# Altium schematic sheet HMI_Encoder_NFC_Sheet.SchDoc
size A4
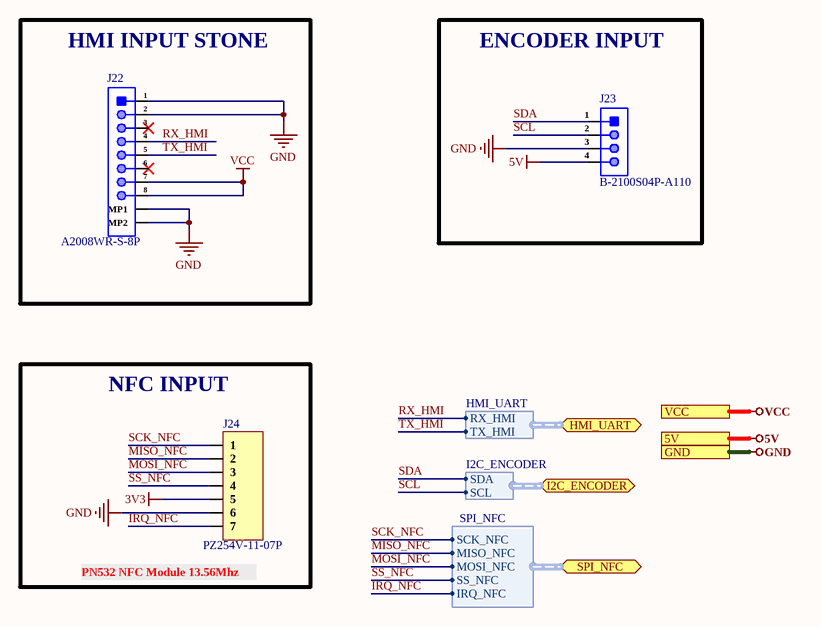
[diagram p0: HMI_Encoder_NFC_Sheet.SchDoc]

## Parts
J22  A2008WR-S-8P  [A2008WR-S-8P]
J23  B-2100S04P-A110  [HDR1X4_]
J24  PZ254V-11-07P  [HDR1X7]

## Blocks framed on the sheet
HMI INPUT STONE: J22
ENCODER INPUT: J23
NFC INPUT: J24

## Ports
5V, GND, HMI_UART (bidir, harness HMI_UART), I2C_ENCODER (bidir, harness I2C_ENCODER), SPI_NFC (bidir, harness SPI_NFC), VCC

## Harnesses
HMI_UART: RX_HMI, TX_HMI
I2C_ENCODER: SDA, SCL
SPI_NFC: MISO_NFC, MOSI_NFC, SS_NFC, IRQ_NFC, SCK_NFC

## Nets
3V3: J24.5
5V: J23.4 ; port 5V
GND: J22.1 J22.2 J22.MP1 J22.MP2 J23.3 J24.6 ; port GND
VCC: J22.7 J22.8 ; port VCC
IRQ_NFC: J24.7 ; port SPI_NFC.IRQ_NFC
MISO_NFC: J24.2 ; port SPI_NFC.MISO_NFC
MOSI_NFC: J24.3 ; port SPI_NFC.MOSI_NFC
RX_HMI: J22.4 ; port HMI_UART.RX_HMI
SCK_NFC: J24.1 ; port SPI_NFC.SCK_NFC
SCL: J23.2 ; port I2C_ENCODER.SCL
SDA: J23.1 ; port I2C_ENCODER.SDA
SS_NFC: J24.4 ; port SPI_NFC.SS_NFC
TX_HMI: J22.5 ; port HMI_UART.TX_HMI

Not connected (* = marked no-connect by the designer): J22 3* 6*

## Notes on the sheet
- (near J24) PN532 NFC Module 13.56Mhz

## Library data of the parts
J22 = A2008WR-S-8P: 1x8P PH 1 2mm 8 Brass SMD,P=2mm Wire To Board / Wire To Wire Connector ROHS; Manufacturer: CJT; Manufacturer Part Number: A2008WR-S-8P; Package: SMD,P=2mm; LCSC Part Number: C273136; Item Type: Wire To Wire Connector; ComponentLink1Description: LCSC; ComponentLink1URL: https://www.lcsc.com/product-detail/_Changjiang-Connectors-A2008WR-S-8P_C273136.html
J23 = B-2100S04P-A110: Straight 2.54mm Black Brass 1x4P Plugin,P=2.54mm Pin Headers ROHS; Manufacturer: Ckmtw; Item Type: Header; LCSC Part Number: C124378; Manufacturer Part Number: B-2100S04P-A110; ComponentLink1Description: LCSC; ComponentLink1URL: https://www.lcsc.com/product-detail/Pin-Headers_Ckmtw-Shenzhen-Cankemeng-B-2100S04P-A110_C124378.html
J24 = PZ254V-11-07P: Straight Square Pins 2.5mm 7P 6mm -40℃~+105℃ 3mm 2.54mm Plugin Black Brass 1x7P Plugin,P=2.54mm Pin Headers ROHS; Manufacturer: XFCN; Item Type: Male Header; Manufacturer Part Number: PZ254V-11-07P; Package: Plugin,P=2.54mm; LCSC Part Number: C492406; ComponentLink1Description: LCSC; ComponentLink1URL: https://www.lcsc.com/product-detail/span-style-background-color-ff0-Pin-span-Headers_XFCN-PZ254V-11-07P_C492406.html